# EasyEDA Pro project MiniPID_Manual.epro, schematic Schematic1
Board Name: Board1; Create Date: 2026-11-03; Page Name: P1; Project Name: MiniPID; Schematic Name: Schematic1; Update Date: 2026-11-03; Company: EasyEDA.com; Page Size: A4; Version: V1.0
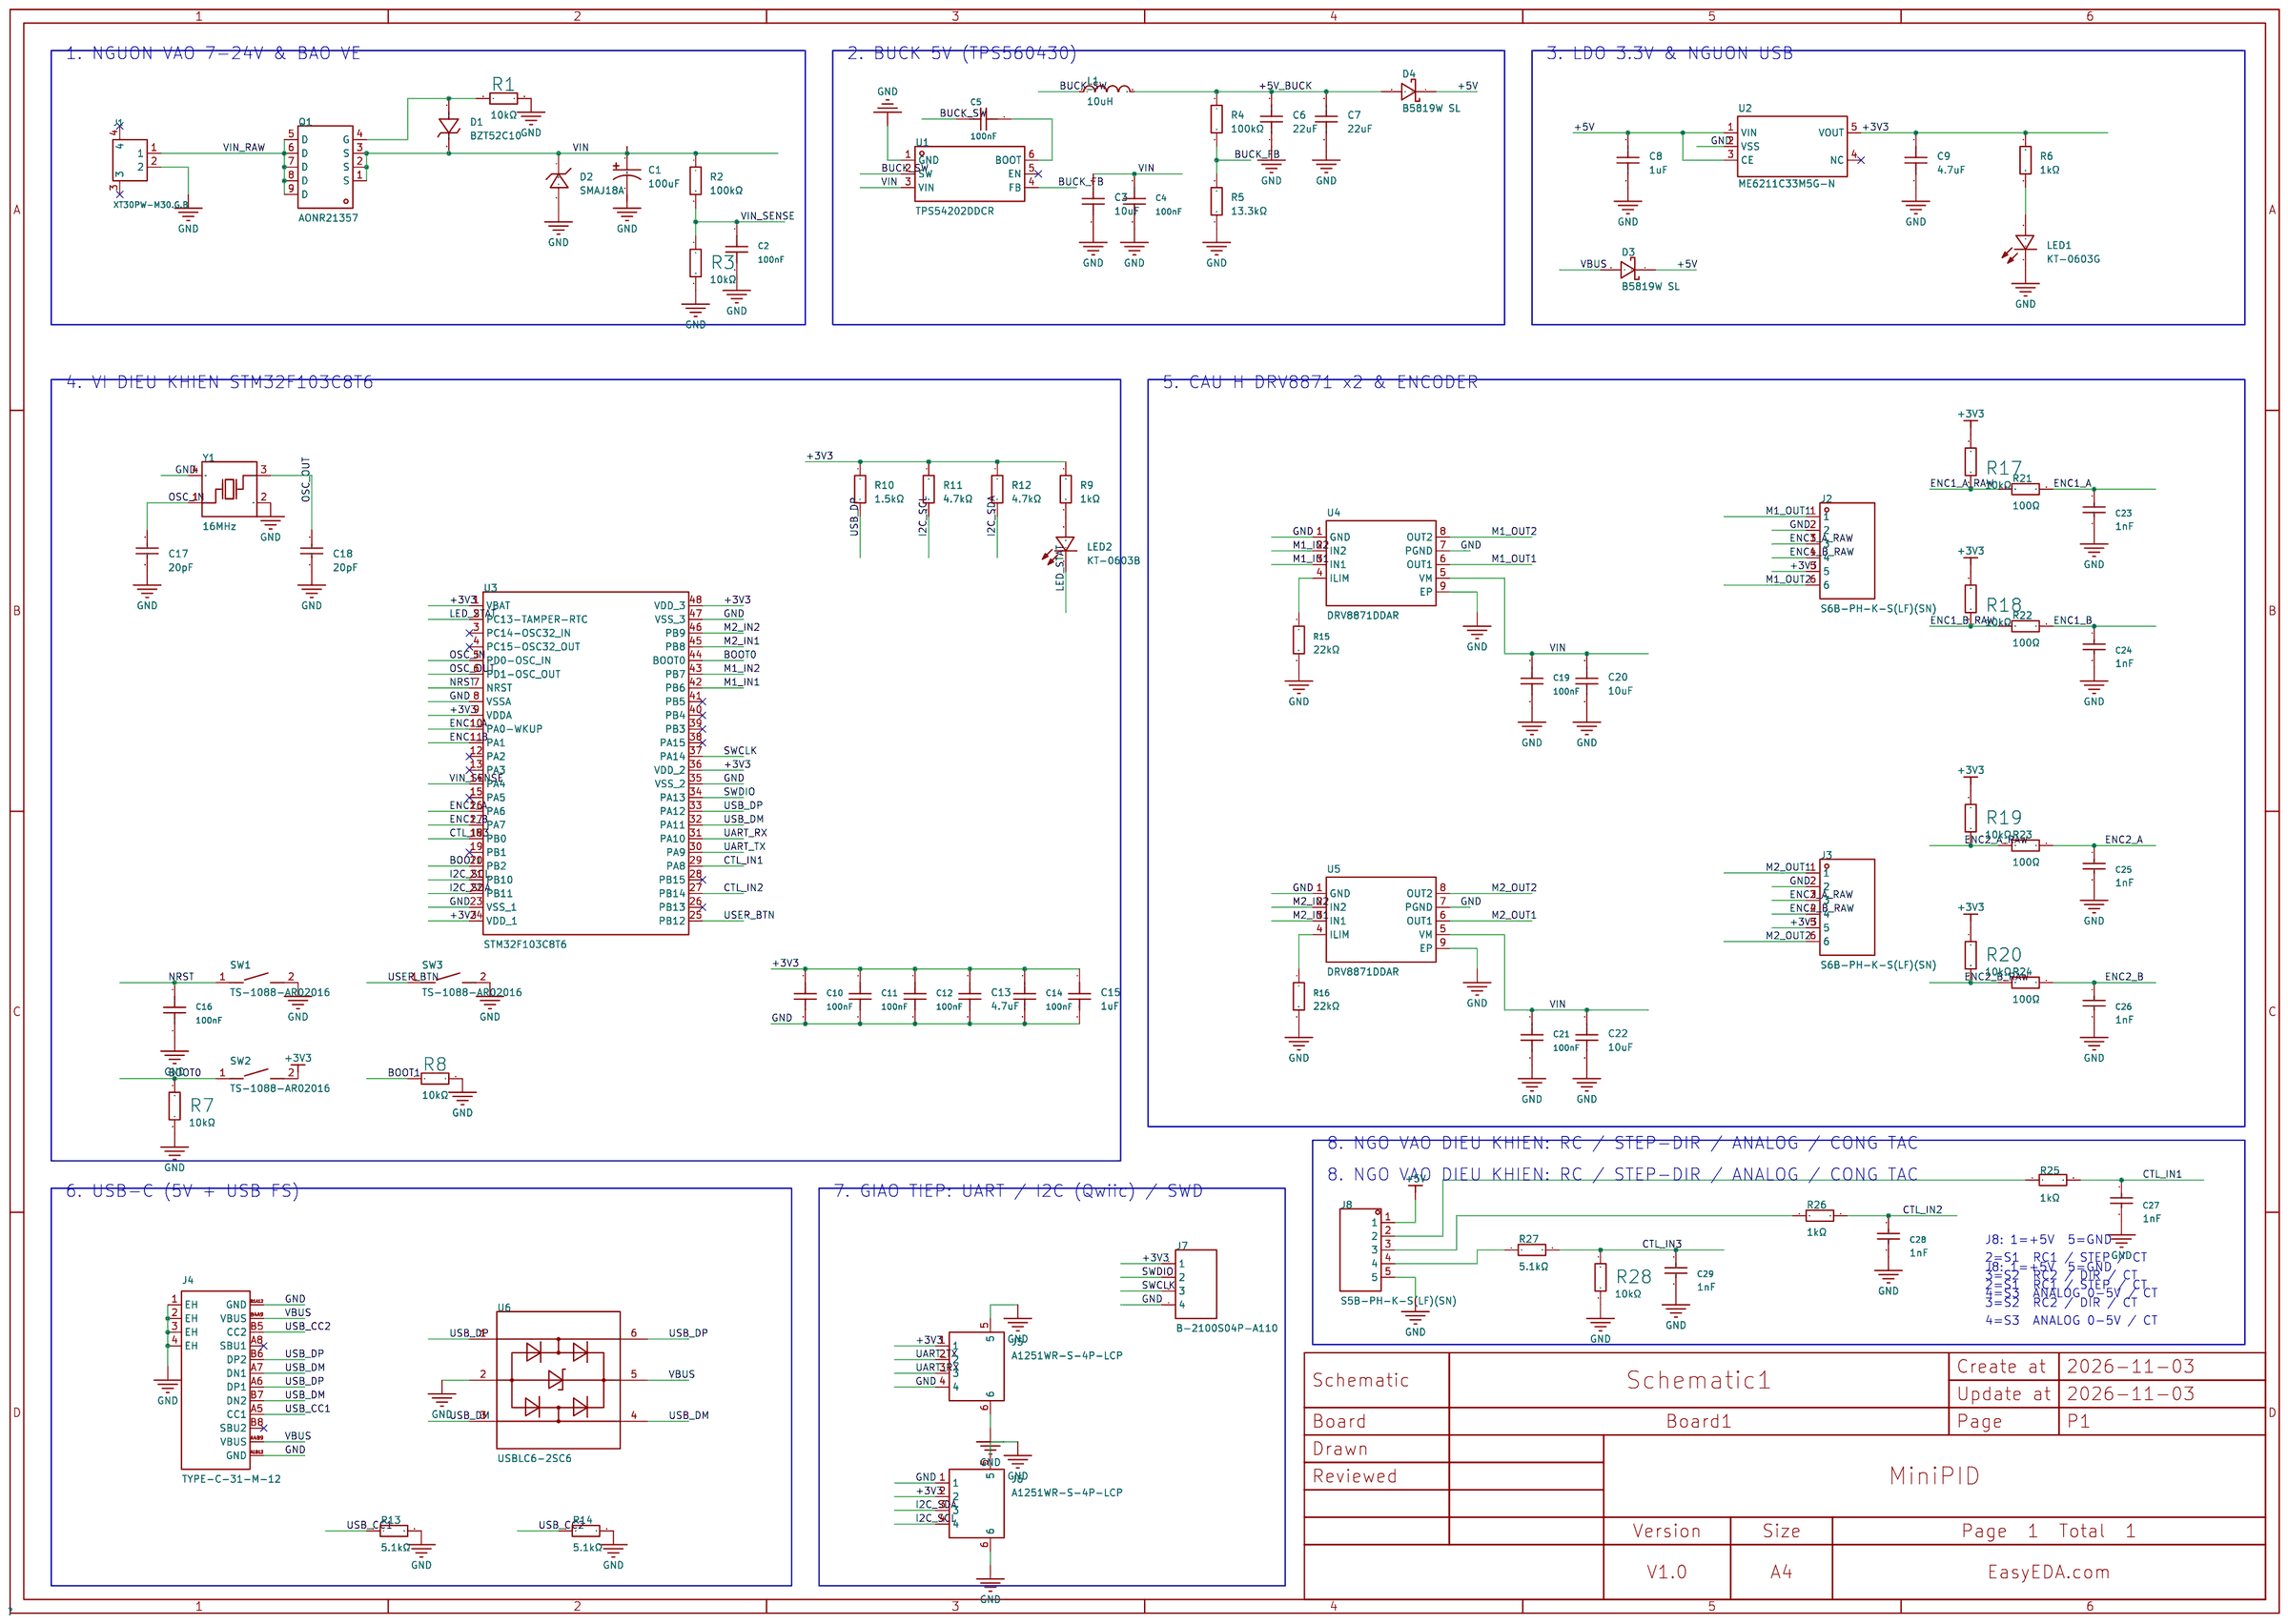
[diagram p0: schematic sheet]

## Parts
C1  100uF  [CAP-TH_BD6.3-P2.50-D1.0-FD]
C2  100nF  [C0603]
C3  10uF  [C0805]
C4  100nF  [C0603]
C5  100nF  [C0603]
C6  22uF  [C0805]
C7  22uF  [C0805]
C8  1uF  [C0603]
C9  4.7uF  [C0603]
C10  100nF  [C0603]
C11  100nF  [C0603]
C12  100nF  [C0603]
C13  4.7uF  [C0603]
C14  100nF  [C0603]
C15  1uF  [C0603]
C16  100nF  [C0603]
C17  20pF  [C0603]
C18  20pF  [C0603]
C19  100nF  [C0603]
C20  10uF  [C0805]
C21  100nF  [C0603]
C22  10uF  [C0805]
C23  1nF  [C0603]
C24  1nF  [C0603]
C25  1nF  [C0603]
C26  1nF  [C0603]
C27  1nF  [C0603]
C28  1nF  [C0603]
C29  1nF  [C0603]
D1  BZT52C10  [SOD-123_L2.7-W1.6-LS3.7-RD-1]
D2  SMAJ18A  [SMA_L4.3-W2.6-LS5.2-RD]
D3  B5819W SL  [SOD-123_L2.7-W1.6-LS3.7-RD-1]
D4  B5819W SL  [SOD-123_L2.7-W1.6-LS3.7-RD-1]
J1  XT30PW-M30.G.B  [CONN-TH_XT30PW-M]
J2  S6B-PH-K-S(LF)(SN)  [CONN-TH_6P-P2.00_S6B-PH-K-S-LF-SN]
J3  S6B-PH-K-S(LF)(SN)  [CONN-TH_6P-P2.00_S6B-PH-K-S-LF-SN]
J4  TYPE-C-31-M-12  [USB-C_SMD-TYPE-C-31-M-12_1]
J5  A1251WR-S-4P-LCP  [CONN-SMD_A1251WR-S-4P]
J6  A1251WR-S-4P-LCP  [CONN-SMD_A1251WR-S-4P]
J7  B-2100S04P-A110  [HDR-TH_4P-P2.54-V-M]
J8  S5B-PH-K-S(LF)(SN)  [CONN-TH_S5B-PH-K-S-LF-SN]
L1  10uH  [IND-SMD_L6.0-W6.0_SWPA6045S]
LED1  KT-0603G  [LED0603-RD]
LED2  KT-0603B  [LED0603-RD]
Q1  AONR21357  [DFN-8_L3.0-W3.0-P0.65-BL]
R1  10kΩ  [R0603]
R2  100kΩ  [R0603]
R3  10kΩ  [R0603]
R4  100kΩ  [R0603]
R5  13.3kΩ  [R0603]
R6  1kΩ  [R0603]
R7  10kΩ  [R0603]
R8  10kΩ  [R0603]
R9  1kΩ  [R0603]
R10  1.5kΩ  [R0603]
R11  4.7kΩ  [R0603]
R12  4.7kΩ  [R0603]
R13  5.1kΩ  [R0603]
R14  5.1kΩ  [R0603]
R15  22kΩ  [R0603]
R16  22kΩ  [R0603]
R17  10kΩ  [R0603]
R18  10kΩ  [R0603]
R19  10kΩ  [R0603]
R20  10kΩ  [R0603]
R21  100Ω  [R0603]
R22  100Ω  [R0603]
R23  100Ω  [R0603]
R24  100Ω  [R0603]
R25  1kΩ  [R0603]
R26  1kΩ  [R0603]
R27  5.1kΩ  [R0603]
R28  10kΩ  [R0603]
SW1  TS-1088-AR02016  [SW-SMD_L3.9-W3.0-P4.45]
SW2  TS-1088-AR02016  [SW-SMD_L3.9-W3.0-P4.45]
SW3  TS-1088-AR02016  [SW-SMD_L3.9-W3.0-P4.45]
U1  TPS54202DDCR  [SOT-23-6_L2.9-W1.6-P0.95-LS2.8-BL]
U2  ME6211C33M5G-N  [SOT-23-5_L3.0-W1.7-P0.95-LS2.8-BL]
U3  STM32F103C8T6  [LQFP-48_L7.0-W7.0-P0.50-LS9.0-BL]
U4  DRV8871DDAR  [SO-8_L4.9-W3.9-P1.27-LS6.0-BL-EP]
U5  DRV8871DDAR  [SO-8_L4.9-W3.9-P1.27-LS6.0-BL-EP]
U6  USBLC6-2SC6  [SOT-23-6_L2.9-W1.6-P0.95-LS2.8-BL]
Y1  16MHz  [CRYSTAL-SMD_4P-L3.2-W2.5-BL]

## Library data of the parts
C1 = NXA35VB100M6.3*11_LO: Capacitance: Rated Voltage: Lead Spacing: φD: L: Lifetime @ Temp:; LCSC Part Name: 100uF 35V; Supplier Part: C346956; Supplier Footprint: 插件,6.3x11mm; JLCPCB Part Class: Extended Part; Supplier: LCSC
C2 C4 C5 C10-C12 C14 C16 C19 C21 = CC0603KRX7R9BB104: Capacitance:100nF Tolerance:±10% Tolerance:±10% Voltage Rating:50V Temperature Coefficient:X7R; LCSC Part Name: 100nF ±10% 50V; Supplier Part: C14663; Manufacturer: YAGEO(国巨); Supplier Footprint: 0603; JLCPCB Part Class: Basic Part; Datasheet: https://item.szlcsc.com/datasheet/CC0603KRX7R9BB104/15331.html; Supplier: LCSC; Tolerance: ±10%; Voltage Rating: 50V; Temperature Coefficient: X7R
C3 C20 C22 = GRM21BR61H106KE43L: Capacitance:10uF Tolerance:±10% Tolerance:±10% Voltage Rating:50V Temperature Coefficient:X5R; LCSC Part Name: 10uF ±10% 50V; Supplier Part: C440198; Manufacturer: muRata(村田); Supplier Footprint: 0805; JLCPCB Part Class: Basic Part; Datasheet: https://item.szlcsc.com/datasheet/GRM21BR61H106KE43L/439567.html; Supplier: LCSC; Tolerance: ±10%; Voltage Rating: 50V; Temperature Coefficient: X5R
C6 C7 = CL21A226MAQNNNE: Capacitance:22uF Tolerance:±20% Tolerance:±20% Voltage Rating:25V Temperature Coefficient:X5R; LCSC Part Name: 22uF ±20% 25V; Supplier Part: C45783; Manufacturer: SAMSUNG(三星); Supplier Footprint: 0805; JLCPCB Part Class: Basic Part; Datasheet: https://item.szlcsc.com/datasheet/CL21A226MAQNNNE/46786.html; Supplier: LCSC; Tolerance: ±20%; Voltage Rating: 25V; Temperature Coefficient: X5R
C8 C15 = CL10A105KB8NNNC: Capacitance:1uF Tolerance:±10% Tolerance:±10% Voltage Rating:50V Temperature Coefficient:X5R; LCSC Part Name: 1uF ±10% 50V; Supplier Part: C15849; Manufacturer: SAMSUNG(三星); Supplier Footprint: 0603; JLCPCB Part Class: Basic Part; Datasheet: https://item.szlcsc.com/datasheet/CL10A105KB8NNNC/16531.html; Supplier: LCSC; Tolerance: ±10%; Voltage Rating: 50V; Temperature Coefficient: X5R
C9 C13 = CL10A475KO8NNNC: Capacitance:4.7uF Tolerance:±10% Tolerance:±10% Voltage Rating:16V Temperature Coefficient:X5R; LCSC Part Name: 4.7uF ±10% 16V; Supplier Part: C19666; Manufacturer: SAMSUNG(三星); Supplier Footprint: 0603; JLCPCB Part Class: Basic Part; Datasheet: https://item.szlcsc.com/datasheet/CL10A475KO8NNNC/20375.html; Supplier: LCSC; Tolerance: ±10%; Voltage Rating: 16V; Temperature Coefficient: X5R
C17 C18 = CL10C200JB8NNNC: Capacitance:20pF Tolerance:±5% Tolerance:±5% Voltage Rating:50V Temperature Coefficient:C0G; LCSC Part Name: 20pF ±5% 50V; Supplier Part: C1648; Manufacturer: SAMSUNG(三星); Supplier Footprint: 0603; JLCPCB Part Class: Basic Part; Datasheet: https://item.szlcsc.com/datasheet/CL10C200JB8NNNC/2000.html; Supplier: LCSC; Tolerance: ±5%; Voltage Rating: 50V; Temperature Coefficient: C0G
C23-C29 = CL10B102KB8NNNC: Capacitance:1nF Tolerance:±10% Tolerance:±10% Voltage Rating:50V Temperature Coefficient:X7R Operating Temperature:-55℃~+125℃ Operating Temperature:-55℃~+125℃; LCSC Part Name: 1nF ±10% 50V; Supplier Part: C1588; Manufacturer: SAMSUNG(三星); Supplier Footprint: 0603; JLCPCB Part Class: Basic Part; Datasheet: https://item.szlcsc.com/datasheet/CL10B102KB8NNNC/1940.html; Supplier: LCSC; Tolerance: ±10%; Voltage Rating: 50V; Temperature Coefficient: X7R; Operating Temperature: -55℃~+125℃
D1 = BZT52C10: Diode Configuration:1 Independent Zener Voltage(Nom):10V Reverse Leakage Current (Ir):200nA@7V Zener Voltage(Range):9.4V~10.6V Zener Voltage(Range):9.4V~10.6V Pd - Power Dissipation:500mW Impedance(Zzt):20Ω Impedance(Zzk):150Ω Operating Junction Temperatu; LCSC Part Name: 独立式 耐压:10V 电流:0.2uA@7.0V; Supplier Part: C707140; Manufacturer: Slkor(萨科微); Supplier Footprint: SOD-123; JLCPCB Part Class: Extended Part; Datasheet: https://item.szlcsc.com/datasheet/BZT52C10/744262.html; Supplier: LCSC; Diode Configuration: 1 Independent; Zener Voltage(Nom): 10V; Reverse Leakage Current (Ir): 200nA@7V; Zener Voltage(Range): 9.4V~10.6V; Pd - Power Dissipation: 500mW; Impedance(Zzt): 20Ω; Impedance(Zzk): 150Ω; Operating Junction Temperature Range: -65℃~+150℃
D2 = SMAJ18A: Reverse Stand-Off Voltage (Vrwm):18V Maximum Clamping Voltage:29.2V Peak Pulse Current (Ipp)@10/1000us:13.7A Breakdown Voltage:20V Type:TVS; LCSC Part Name: 单向TVS 18V截止 13.7A峰值脉冲; Supplier Part: C400806; Supplier Footprint: SMA; JLCPCB Part Class: Extended Part; Datasheet: https://atta.szlcsc.com/upload/public/pdf/source/20190627/C400806_7E410893A8120FEC104604328EAF2CE5.pdf; Supplier: LCSC; Reverse Stand-Off Voltage (Vrwm): 18V; Maximum Clamping Voltage: 29.2V; Peak Pulse Current (Ipp)@10/1000us: 13.7A; Breakdown Voltage: 20V; Type: TVS
D3 D4 = B5819W SL: Voltage - Forward(Vf@If):600mV@1A Voltage - DC Reverse(Vr):40V Current - Rectified:1A Non-Repetitive Peak Forward Surge Current:9A; LCSC Part Name: 电压:40V 电流:1A; Supplier Part: C8598; Manufacturer: CJ(江苏长电/长晶); Supplier Footprint: SOD-123; JLCPCB Part Class: Basic Part; Datasheet: https://item.szlcsc.com/datasheet/B5819W%2520SL/9093.html; Supplier: LCSC; Voltage - Forward(Vf@If): 600mV@1A; Voltage - DC Reverse(Vr): 40V; Current - Rectified: 1A; Non-Repetitive Peak Forward Surge Current: 9A
J1 = XT30PW-M30.G.B: LCSC Part Name: AMASS(艾迈斯)航模插头电调机插座锂电池连接器 PCB板卧式 金 黑XT30PW-M30.G.B; Supplier Part: C30170177; Manufacturer: null; JLCPCB Part Class: Extended Part; Datasheet: https://item.szlcsc.com/datasheet/XT30PW-M30.G.B/31902144.html; Supplier: LCSC
J2 J3 = S6B-PH-K-S(LF)(SN): Pins Structure:1x6P Pitch:2mm Mounting Type:Right Angle Reference Series:PH Number of Pins:6P Number of Rows:1 Number of PINs Per Row:6 Row Spacing:- Current Rating:2A Contact Material:Brass Contact Plating:Tin Operating Temperature:-25℃~+85℃ Operating Te; LCSC Part Name: 1x6P 间距:2mm 弯插 系列:PH; Supplier Part: C157920; Manufacturer: JST; Supplier Footprint: 弯插,P=2mm; JLCPCB Part Class: Extended Part; Datasheet: https://item.szlcsc.com/datasheet/S6B-PH-K-S(LF)(SN)/169268.html; Supplier: LCSC; Pins Structure: 1x6P; Pitch: 2mm; Mounting Type: Right Angle; Reference Series: PH; Number of Pins: 6P; Number of Rows: 1; Number of PINs Per Row: 6; Current Rating: 2A; Contact Material: Brass; Contact Plating: Tin; Operating Temperature: -25℃~+85℃; Voltage Rating: 100V; Plastic Material: PA66; Flame Retardant Rating: UL94V-0; Supplementary Features: K Pin; Color: White; Z-Height of the Board: 4.8mm; X-Length of Bottom Edge on Board (Spacing Line): 13.9mm; Y-Width of Bottom Edge on Board: 7.6mm
J4 = TYPE-C-31-M-12: Connector Type:Type-C Protocol Standard:- Gender:Female Mounting Type:Surface Mount, Right Angle Number of Contacts:16P Number of Ports:1 Current Rating-Power:5A Voltage Rating:20V Connect-Disconnect Life:10,000 cycles Length:7.35mm Operating Temperature:; LCSC Part Name: Type-C 母 卧贴; Supplier Part: C165948; Manufacturer: 韩国韩荣; Supplier Footprint: SMD; JLCPCB Part Class: Extended Part; Datasheet: https://item.szlcsc.com/datasheet/TYPE-C-31-M-12/177331.html; Supplier: LCSC; Connector Type: Type-C; Gender: Female; Mounting Type: Surface Mount, Right Angle; Number of Contacts: 16P; Number of Ports: 1; Current Rating-Power: 5A; Voltage Rating: 20V; Connect-Disconnect Life: 10,000 cycles; Length: 7.35mm; Operating Temperature: -30℃~+80℃
J5 J6 = A1251WR-S-4P-LCP: Pins Structure:1x4P Pitch:1.25mm Mounting Type:Surface Mount, Right Angle Reference Series:- Number of Pins:4P Number of Rows:1 Number of PINs Per Row:4 Row Spacing:- Current Rating:1A Contact Material:Phosphor Bronze Contact Plating:Tin Operating Tempera; LCSC Part Name: 1x4P 间距:1.25mm 卧贴; Supplier Part: C225113; Manufacturer: CJT(长江连接器); Supplier Footprint: SMD,P=1.25mm,卧贴; JLCPCB Part Class: Extended Part; Datasheet: https://item.szlcsc.com/datasheet/A1251WR-S-4P-LCP/225396.html; Supplier: LCSC; Pins Structure: 1x4P; Pitch: 1.25mm; Mounting Type: Surface Mount, Right Angle; Number of Pins: 4P; Number of Rows: 1; Number of PINs Per Row: 4; Current Rating: 1A; Contact Material: Phosphor Bronze; Contact Plating: Tin; Operating Temperature: -40℃~+105℃; Voltage Rating: 125V; Plastic Material: LCP; Flame Retardant Rating: UL94V-0; Color: Beige; Z-Height of the Board: 3.6mm; X-Length of Bottom Edge on Board (Spacing Line): 10.25mm; Y-Width of Bottom Edge on Board: 5.5mm
J7 = B-2100S04P-A110: Pin Structure:1x4P Pitch:2.54mm Row Spacing:- Circluar Pins/Square Pins:Pin Header Mounting Type:Through Hole Number of Rows:1 Number of Pins:4P Current Rating:3A Voltage Rating (Max):- Length of Mating Pin:6mm Insulation Height:2.54mm Length of End Conne; LCSC Part Name: 1x4P 间距:2.54mm 方针 直插; Supplier Part: C124378; Manufacturer: Ckmtw(灿科盟); Supplier Footprint: 插件,P=2.54mm; JLCPCB Part Class: Extended Part; Datasheet: https://item.szlcsc.com/datasheet/B-2100S04P-A110/125653.html; Supplier: LCSC; Pin Structure: 1x4P; Pitch: 2.54mm; Circluar Pins/Square Pins: Pin Header; Mounting Type: Through Hole; Number of Rows: 1; Number of Pins: 4P; Current Rating: 3A; Length of Mating Pin: 6mm; Insulation Height: 2.54mm; Length of End Connection Pin: 3mm; Contact Material: Brass; Operating Temperature: -40℃~+105℃; Color: Black
J8 = S5B-PH-K-S(LF)(SN): Pins Structure:1x5P Pitch:2mm Mounting Type:Right Angle Reference Series:PH Number of Pins:5P Number of Rows:1 Number of PINs Per Row:5 Row Spacing:- Current Rating:2A Contact Material:Brass Contact Plating:Tin Operating Temperature:-25℃~+85℃ Operating Te; LCSC Part Name: 1x5P 间距:2mm 弯插 系列:PH; Supplier Part: C157923; Manufacturer: JST; Supplier Footprint: 弯插,P=2mm; JLCPCB Part Class: Extended Part; Datasheet: https://item.szlcsc.com/datasheet/S5B-PH-K-S(LF)(SN)/169271.html; Supplier: LCSC; Pins Structure: 1x5P; Pitch: 2mm; Mounting Type: Right Angle; Reference Series: PH; Number of Pins: 5P; Number of Rows: 1; Number of PINs Per Row: 5; Current Rating: 2A; Contact Material: Brass; Contact Plating: Tin; Operating Temperature: -25℃~+85℃; Voltage Rating: 100V; Plastic Material: PA66; Flame Retardant Rating: UL94V-0; Supplementary Features: K Pin; Color: White; Z-Height of the Board: 4.8mm; X-Length of Bottom Edge on Board (Spacing Line): 11.9mm; Y-Width of Bottom Edge on Board: 7.6mm
L1 = SWPA6045S100MT: Inductance: Tolerance:±20% Tolerance:±20% Rated Current: Current - Saturation(Isat):3.5A DC Resistance(DCR): Type:- Ratings:-; LCSC Part Name: 10uH ±20% 3.5A; Supplier Part: C79272; Manufacturer: Sunlord(顺络); Supplier Footprint: SMD,6x6mm; JLCPCB Part Class: Extended Part; Datasheet: https://atta.szlcsc.com/upload/public/pdf/source/20231024/317626D2AA2F8AB4113C1875E432E6E1.pdf; Supplier: LCSC; Tolerance: ±20%; Current - Saturation(Isat): 3.5A
LED1 = KT-0603G: Lamp Holder Type:1.6mm x 0.8mm square LED Illumination Color:Emerald Green Voltage - Forward(Vf):3.1V Voltage - Forward(Vf):3.1V Power(Watts):100mW Forward Current:5mA Wavelength - Dominant:513nm~528nm Wavelength - Dominant:513nm~528nm Peak Wavelength:525; LCSC Part Name: 0603 翠绿 高亮; Supplier Part: C12624; Manufacturer: KENTO; Supplier Footprint: 0603; JLCPCB Part Class: Extended Part; Datasheet: https://item.szlcsc.com/datasheet/KT-0603G/13258.html; Supplier: LCSC; Lamp Holder Type: 1.6mm x 0.8mm square LED; Illumination Color: Emerald Green; Voltage - Forward(Vf): 3.1V; Power(Watts): 100mW; Forward Current: 5mA; Wavelength - Dominant: 513nm~528nm; Peak Wavelength: 525nm; Diode Configuration: Discrete Diode; Lens Color: Water Clear; Luminous Intensity: 430mcd; Viewing Angle: 120°; Operating Temperature: -40℃~+85℃
LED2 = KT-0603B: Lamp Holder Type:1.6mm x 0.8mm square LED Illumination Color:Blue Voltage - Forward(Vf):3.1V Voltage - Forward(Vf):3.1V Power(Watts):100mW Forward Current:5mA Wavelength - Dominant:460nm~475nm Wavelength - Dominant:460nm~475nm Peak Wavelength:469nm Peak W; LCSC Part Name: 0603 蓝灯 高亮; Supplier Part: C2288; Manufacturer: KENTO; Supplier Footprint: 0603; JLCPCB Part Class: Extended Part; Datasheet: https://item.szlcsc.com/datasheet/KT-0603B/2661.html; Supplier: LCSC; Lamp Holder Type: 1.6mm x 0.8mm square LED; Illumination Color: Blue; Voltage - Forward(Vf): 3.1V; Power(Watts): 100mW; Forward Current: 5mA; Wavelength - Dominant: 460nm~475nm; Peak Wavelength: 469nm; Diode Configuration: Discrete Diode; Lens Color: Water Clear; Luminous Intensity: 175mcd; Viewing Angle: 120°; Operating Temperature: -40℃~+85℃
Q1 = AONR21357: Number:1 P-Channel Drain to Source Voltage:30V Current - Continuous Drain(Id):34A RDS(on):12.3mΩ@4.5V Pd - Power Dissipation:30W Gate Threshold Voltage (Vgs(th)):1.7V Gate Charge(Qg):25nC@4.5V Input Capacitance(Ciss):2.83nF Reverse Transfer Capacitance (C; LCSC Part Name: 1个P沟道 耐压:30V 电流:34A; Supplier Part: C431196; Manufacturer: AOS; Supplier Footprint: DFN-8(3x3); JLCPCB Part Class: Extended Part; Datasheet: https://item.szlcsc.com/datasheet/AONR21357/427208.html; Supplier: LCSC; Number: 1 P-Channel; Drain to Source Voltage: 30V; Current - Continuous Drain(Id): 34A; RDS(on): 12.3mΩ@4.5V; Pd - Power Dissipation: 30W; Gate Threshold Voltage (Vgs(th)): 1.7V; Gate Charge(Qg): 25nC@4.5V; Input Capacitance(Ciss): 2.83nF; Reverse Transfer Capacitance (Crss@Vds): 365pF; Operating Temperature: -55℃~+150℃; Type: P-Channel; Output Capacitance(Coss): 430pF; Vgs: ±25V
R1 R3 R7 R8 R17-R20 R28 = 0603WAF1002T5E: Type:Thick Film Resistor Resistance:10kΩ Tolerance:±1% Tolerance:±1% Power(Watts):100mW Voltage-Supply(Max):75V Temperature Coefficient:±100ppm/℃ Temperature Coefficient:±100ppm/℃ Operating Temperature:-55℃~+155℃ Operating Temperature:-55℃~+155℃; LCSC Part Name: 厚膜电阻 10kΩ ±1% 100mW; Supplier Part: C25804; Manufacturer: UNI-ROYAL(厚声); Supplier Footprint: 0603; JLCPCB Part Class: Basic Part; Datasheet: https://item.szlcsc.com/datasheet/0603WAF1002T5E/26547.html; Supplier: LCSC; Type: Thick Film Resistor; Tolerance: ±1%; Power(Watts): 100mW; Voltage-Supply(Max): 75V; Temperature Coefficient: ±100ppm/℃; Operating Temperature: -55℃~+155℃
R2 R4 = 0603WAF1003T5E: Type:Thick Film Resistor Resistance:100kΩ Tolerance:±1% Tolerance:±1% Power(Watts):100mW Voltage-Supply(Max):75V Temperature Coefficient:±100ppm/℃ Temperature Coefficient:±100ppm/℃ Operating Temperature:-55℃~+155℃ Operating Temperature:-55℃~+155℃; LCSC Part Name: 厚膜电阻 100kΩ ±1%; Supplier Part: C25803; Manufacturer: UNI-ROYAL(厚声); Supplier Footprint: 0603; JLCPCB Part Class: Basic Part; Datasheet: https://item.szlcsc.com/datasheet/0603WAF1003T5E/26546.html; Supplier: LCSC; Type: Thick Film Resistor; Tolerance: ±1%; Power(Watts): 100mW; Voltage-Supply(Max): 75V; Temperature Coefficient: ±100ppm/℃; Operating Temperature: -55℃~+155℃
R5 = 0603WAF1332T5E: Type:Thick Film Resistor Resistance:13.3kΩ Tolerance:±1% Tolerance:±1% Power(Watts):100mW Voltage-Supply(Max):75V Temperature Coefficient:±100ppm/℃ Temperature Coefficient:±100ppm/℃ Operating Temperature:-55℃~+155℃ Operating Temperature:-55℃~+155℃; LCSC Part Name: 13.3kΩ ±1% 100mW 厚膜电阻; Supplier Part: C25952; Manufacturer: UNI-ROYAL(厚声); Supplier Footprint: 0603; JLCPCB Part Class: Extended Part; Datasheet: https://item.szlcsc.com/datasheet/0603WAF1332T5E/26695.html; Supplier: LCSC; Type: Thick Film Resistor; Tolerance: ±1%; Power(Watts): 100mW; Voltage-Supply(Max): 75V; Temperature Coefficient: ±100ppm/℃; Operating Temperature: -55℃~+155℃
R6 R9 R25 R26 = 0603WAF1001T5E: Type:Thick Film Resistor Resistance:1kΩ Tolerance:±1% Tolerance:±1% Power(Watts):100mW Voltage-Supply(Max):75V Temperature Coefficient:±100ppm/℃ Temperature Coefficient:±100ppm/℃ Operating Temperature:-55℃~+155℃ Operating Temperature:-55℃~+155℃; LCSC Part Name: 1kΩ ±1% 100mW 厚膜电阻; Supplier Part: C21190; Manufacturer: UNI-ROYAL(厚声); Supplier Footprint: 0603; JLCPCB Part Class: Basic Part; Datasheet: https://item.szlcsc.com/datasheet/0603WAF1001T5E/21904.html; Supplier: LCSC; Type: Thick Film Resistor; Tolerance: ±1%; Power(Watts): 100mW; Voltage-Supply(Max): 75V; Temperature Coefficient: ±100ppm/℃; Operating Temperature: -55℃~+155℃
R10 = 0603WAF1501T5E: Type:Thick Film Resistor Resistance:1.5kΩ Tolerance:±1% Tolerance:±1% Power(Watts):100mW Voltage-Supply(Max):75V Temperature Coefficient:±100ppm/℃ Temperature Coefficient:±100ppm/℃ Operating Temperature:-55℃~+155℃ Operating Temperature:-55℃~+155℃; LCSC Part Name: 厚膜电阻 1.5kΩ ±1%; Supplier Part: C22843; Manufacturer: UNI-ROYAL(厚声); Supplier Footprint: 0603; JLCPCB Part Class: Basic Part; Datasheet: https://item.szlcsc.com/datasheet/0603WAF1501T5E/23570.html; Supplier: LCSC; Type: Thick Film Resistor; Tolerance: ±1%; Power(Watts): 100mW; Voltage-Supply(Max): 75V; Temperature Coefficient: ±100ppm/℃; Operating Temperature: -55℃~+155℃
R11 R12 = 0603WAF4701T5E: Type:Thick Film Resistor Resistance:4.7kΩ Tolerance:±1% Tolerance:±1% Power(Watts):100mW Voltage-Supply(Max):75V Temperature Coefficient:±100ppm/℃ Temperature Coefficient:±100ppm/℃ Operating Temperature:-55℃~+155℃ Operating Temperature:-55℃~+155℃; LCSC Part Name: 厚膜电阻 4.7kΩ ±1%; Supplier Part: C23162; Manufacturer: UNI-ROYAL(厚声); Supplier Footprint: 0603; JLCPCB Part Class: Basic Part; Datasheet: https://item.szlcsc.com/datasheet/0603WAF4701T5E/23889.html; Supplier: LCSC; Type: Thick Film Resistor; Tolerance: ±1%; Power(Watts): 100mW; Voltage-Supply(Max): 75V; Temperature Coefficient: ±100ppm/℃; Operating Temperature: -55℃~+155℃
R13 R14 R27 = 0603WAF5101T5E: Type:Thick Film Resistor Resistance:5.1kΩ Tolerance:±1% Tolerance:±1% Power(Watts):100mW Voltage-Supply(Max):75V Temperature Coefficient:±100ppm/℃ Temperature Coefficient:±100ppm/℃ Operating Temperature:-55℃~+155℃ Operating Temperature:-55℃~+155℃; LCSC Part Name: 厚膜电阻 5.1kΩ ±1%; Supplier Part: C23186; Manufacturer: UNI-ROYAL(厚声); Supplier Footprint: 0603; JLCPCB Part Class: Basic Part; Datasheet: https://item.szlcsc.com/datasheet/0603WAF5101T5E/23913.html; Supplier: LCSC; Type: Thick Film Resistor; Tolerance: ±1%; Power(Watts): 100mW; Voltage-Supply(Max): 75V; Temperature Coefficient: ±100ppm/℃; Operating Temperature: -55℃~+155℃
R15 R16 = 0603WAF2202T5E: Type:Thick Film Resistor Resistance:22kΩ Tolerance:±1% Tolerance:±1% Power(Watts):100mW Voltage-Supply(Max):75V Temperature Coefficient:±100ppm/℃ Temperature Coefficient:±100ppm/℃ Operating Temperature:-55℃~+155℃ Operating Temperature:-55℃~+155℃; LCSC Part Name: 22kΩ ±1% 100mW 厚膜电阻; Supplier Part: C31850; Manufacturer: UNI-ROYAL(厚声); Supplier Footprint: 0603; JLCPCB Part Class: Basic Part; Datasheet: https://item.szlcsc.com/datasheet/0603WAF2202T5E/32812.html; Supplier: LCSC; Type: Thick Film Resistor; Tolerance: ±1%; Power(Watts): 100mW; Voltage-Supply(Max): 75V; Temperature Coefficient: ±100ppm/℃; Operating Temperature: -55℃~+155℃
R21-R24 = 0603WAF1000T5E: Type:Thick Film Resistors Resistance: Tolerance:±1% Tolerance:±1% Power(Watts): Overload Voltage (Max): Temperature Coefficient:±200ppm/℃ Temperature Coefficient:±200ppm/℃ Operating Temperature Range:-55℃~+155℃ Operating Temperature Range:-55℃~+155℃; LCSC Part Name: 100Ω ±1% 100mW 厚膜电阻; Supplier Part: C22775; Manufacturer: UNI-ROYAL(厚声); Supplier Footprint: 0603; JLCPCB Part Class: Basic Part; Datasheet: https://atta.szlcsc.com/upload/public/pdf/source/20200306/C422600_1E6D84923E4A46A82E41ADD87F860B5C.pdf; Supplier: LCSC; Type: Thick Film Resistors; Tolerance: ±1%; Temperature Coefficient: ±200ppm/℃; Operating Temperature Range: -55℃~+155℃
SW1-SW3 = TS-1088-AR02016: Circuit:SPST Actuator Style:Round Button Operating Force:1.6N Mounting Type:Surface Mount,Vertical Length:3.9mm Width:3mm Switch Height:2mm with Bracket:Without Bracket Contact Current:50mA Voltage Rating:12V Actuator/Cap Color:Black With Lamp:- IP Rating; LCSC Part Name: 3.9*3*2mm 立贴 轻触开关; Supplier Part: C720477; Manufacturer: XUNPU(讯普); Supplier Footprint: SMD,4x3mm; JLCPCB Part Class: Basic Part; Datasheet: https://item.szlcsc.com/datasheet/TS-1088-AR02016/763484.html; Supplier: LCSC; Circuit: SPST; Actuator Style: Round Button; Operating Force: 1.6N; Mounting Type: Surface Mount,Vertical; Length: 3.9mm; Width: 3mm; Switch Height: 2mm; with Bracket: Without Bracket; Contact Current: 50mA; Voltage Rating: 12V; Actuator/Cap Color: Black; Termination Style: SMD(SMT) Tab; Life: 100,000 cycles; Operating Temperature: -30℃~+80℃
U1 = TPS54202DDCR: Function:Step-down type Voltage - Supply:4.5V~28V Voltage - Supply:4.5V~28V Output Voltage:- Output Voltage:- Output Current:2A Frequency - Switching:500kHz Frequency - Switching:500kHz Operating Temperature:-40℃~+125℃@(TJ) Operating Temperature:-40℃~+125; LCSC Part Name: 降压型 2A 4.5V~28V; Supplier Part: C191884; Manufacturer: TI(德州仪器); Supplier Footprint: SOT-23-6; JLCPCB Part Class: Extended Part; Datasheet: https://www.ti.com/cn/lit/ds/symlink/tps54202.pdf; Supplier: LCSC; Function: Step-down type; Voltage - Supply: 4.5V~28V; Output Current: 2A; Frequency - Switching: 500kHz; Operating Temperature: -40℃~+125℃@(TJ); Synchronous Rectifier: Yes; Number of Outputs: 1; Topology: Buck; Quiescent Current: 45uA; Switch tube (built-in/external): Built-in; Output Type: Adjustable; Features: Light load efficient mode；Cycle-by-cycle current limiting；Overcurrent Protection；EMI optimization (spread spectrum)；Hiccup current limiting
U2 = ME6211C33M5G-N: Output Configuration:Positive Voltage - Supply:6V Output Voltage:3.3V Output Voltage:3.3V Output Current:500mA Power Supply Rejection Ratio (PSRR):70dB@(1kHz) Voltage Dropout:120mV@(100mA) standby current:60uA Noise:50uVrms Features:Enable control；Short C; LCSC Part Name: 3.3V 500mA 6V; Supplier Part: C82942; Manufacturer: MICRONE(南京微盟); Supplier Footprint: SOT-23-5; JLCPCB Part Class: Extended Part; Datasheet: https://item.szlcsc.com/datasheet/ME6211C33M5G-N/84106.html; Supplier: LCSC; Output Configuration: Positive; Voltage - Supply: 6V; Output Voltage: 3.3V; Output Current: 500mA; Power Supply Rejection Ratio (PSRR): 70dB@(1kHz); Voltage Dropout: 120mV@(100mA); standby current: 60uA; Noise: 50uVrms; Features: Enable control；Short Circuit Protection；Over Current Protection; Operating Temperature: -40℃~+150℃; Output Type: Fixed; Number of Outputs: 1
U3 = STM32F103C8T6: CPU Core:ARM Cortex-M3 CPU Maximum Speed:72MHz Core Size:32 Bit Program Storage Size:64KB Program Memory Type:FLASH RAM Size:20KB EEPROM:- Number of I/O:37 ADC (Bit):12bit Oscillator Type:Built-in Voltage - Supply:2V~3.6V Voltage - Supply:2V~3.6V Operatin; LCSC Part Name: 主流增强型ARM Cortex-M3 MCU，具有64 KB Flash、72 MHz CPU、电机控制、USB和CAN; Supplier Part: C8734; Manufacturer: ST(意法半导体); Supplier Footprint: LQFP-48(7x7); JLCPCB Part Class: Extended Part; Datasheet: https://item.szlcsc.com/datasheet/STM32F103C8T6/9243.html; Supplier: LCSC; CPU Core: ARM Cortex-M3; CPU Maximum Speed: 72MHz; Core Size: 32 Bit; Program Storage Size: 64KB; Program Memory Type: FLASH; RAM Size: 20KB; Number of I/O: 37; ADC (Bit): 12bit; Oscillator Type: Built-in; Voltage - Supply: 2V~3.6V; Operating Temperature: -40℃~+85℃
U4 U5 = DRV8871DDAR: Technology:Yes Number of H-bridges:1 Output Current:- Output Current:- Peak Current:3.6A Voltage - Supply:- Voltage - Supply:- Interface:PWM RDS(on):565mΩ Quiescent Current(Iq):10uA Operating Temperature:-40℃~+125℃ Operating Temperature:-40℃~+125℃ Feature; LCSC Part Name: 3.6A 有刷直流电机驱动芯片 5.5V; Supplier Part: C75864; Manufacturer: TI(德州仪器); Supplier Footprint: SO-8-EP; JLCPCB Part Class: Extended Part; Datasheet: https://www.ti.com/cn/lit/ds/symlink/drv8871.pdf; Supplier: LCSC; Technology: Yes; Number of H-bridges: 1; Peak Current: 3.6A; Interface: PWM; RDS(on): 565mΩ; Quiescent Current(Iq): 10uA; Operating Temperature: -40℃~+125℃; Features: Active braking function；Interleaved conduction protection；Current sensing/regulation function
U6 = USBLC6-2SC6_C7519: Polarity:Unidirectional Reverse Stand-Off Voltage (Vrwm):5.25V Clamping Voltage:17V Peak Pulse Current (Ipp):5A Voltage - Breakdown:6V Reverse Leakage Current (Ir):150nA Number of Channels:2 Operating Temperature:-40℃~+125℃ Operating Temperature:-40℃~+125; LCSC Part Name: 单向ESD 5.25V截止 峰值脉冲电流：5A; Supplier Part: C7519; Manufacturer: ST(意法半导体); Supplier Footprint: SOT-23-6L; JLCPCB Part Class: Extended Part; Datasheet: https://item.szlcsc.com/datasheet/USBLC6-2SC6/7996.html; Supplier: LCSC; Polarity: Unidirectional; Reverse Stand-Off Voltage (Vrwm): 5.25V; Clamping Voltage: 17V; Peak Pulse Current (Ipp): 5A; Voltage - Breakdown: 6V; Reverse Leakage Current (Ir): 150nA; Number of Channels: 2; Operating Temperature: -40℃~+125℃; level of protection: IEC 61000-4-2; Type: ESD; Junction Capacitance: 3.5pF
Y1 = X322516MLB4SI: Type:Crystal Oscillator Frequency:16MHz Normal temperature Frequency Tolerance:±10ppm Normal temperature Frequency Tolerance:±10ppm Load Capacitance:9pF Frequency Stability:±20ppm Frequency Stability:±20ppm Equivalent Series Resistance(ESR):50Ω Operating; LCSC Part Name: YSX321SL 16MHZ 4P 3225 9PF ±10PPM -40~85℃ (±20PPM); Supplier Part: C13738; Manufacturer: YXC(扬兴晶振); Supplier Footprint: SMD3225-4P; JLCPCB Part Class: Basic Part; Datasheet: https://item.szlcsc.com/datasheet/X322516MLB4SI/14393.html; Supplier: LCSC; Type: Crystal Oscillator; Normal temperature Frequency Tolerance: ±10ppm; Load Capacitance: 9pF; Frequency Stability: ±20ppm; Equivalent Series Resistance(ESR): 50Ω; Operating Temperature: -40℃~+85℃

## Nets
+3V3: C9.1 C10.1 C11.1 C12.1 C13.1 C14.1 C15.1 J2.5 J3.5 J5.1 J6.2 J7.1 R6.1 R9.1 R10.1 R11.1 R12.1 R17.1 R18.1 R19.1 R20.1 SW2.2 U2.5(VOUT) U3.1(VBAT) U3.9(VDDA) U3.24(VDD_1) U3.36(VDD_2) U3.48(VDD_3)
+5V: C8.1 D3.1(-) D4.1(-) J8.1 U2.1(VIN) U2.3(CE)
+5V_BUCK: C6.1 C7.1 D4.2(+) L1.2 R4.1
GND: C1.2 C2.2 C3.2 C4.2 C6.2 C7.2 C8.2 C9.2 C10.2 C11.2 C12.2 C13.2 C14.2 C15.2 C16.2 C17.2 C18.2 C19.2 C20.2 C21.2 C22.2 C23.2 C24.2 C25.2 C26.2 C27.2 C28.2 C29.2 D2.2(A) J1.2 J2.2 J3.2 J4.1(EH) J4.2(EH) J4.3(EH) J4.4(EH) J4.A1B12(GND) J4.B1A12(GND) J5.4 J5.5 J5.6 J6.1 J6.5 J6.6 J7.4 J8.5 LED1.1(K) R1.2 R3.2 R5.1 R7.2 R8.2 R13.2 R14.2 R15.2 R16.2 R28.2 SW1.2 SW3.2 U1.1(GND) U2.2(VSS) U3.8(VSSA) U3.23(VSS_1) U3.35(VSS_2) U3.47(VSS_3) U4.1(GND) U4.7(PGND) U4.9(EP) U5.1(GND) U5.7(PGND) U5.9(EP) U6.2 Y1.2(GND) Y1.4(GND)
VBUS: D3.2(+) J4.A4B9(VBUS) J4.B4A9(VBUS) U6.5
VIN: C1.1 C3.1 C4.1 C19.1 C20.1 C21.1 C22.1 D1.1(C) D2.1(C) Q1.1(S) Q1.2(S) Q1.3(S) R2.1 U1.3(VIN) U4.5(VM) U5.5(VM)
VIN_RAW: J1.1 Q1.5(D) Q1.6(D) Q1.7(D) Q1.8(D) Q1.9(D)
VIN_SENSE: C2.1 R2.2 R3.1 U3.14(PA4)
BOOT0: R7.1 SW2.1 U3.44(BOOT0)
BOOT1: R8.1 U3.20(PB2)
BUCK_FB: R4.2 R5.2 U1.4(FB)
BUCK_SW: C5.1 L1.1 U1.2(SW)
CTL_IN1: C27.1 R25.2 U3.29(PA8)
CTL_IN2: C28.1 R26.2 U3.27(PB14)
CTL_IN3: C29.1 R27.2 R28.1 U3.18(PB0)
ENC1_A: C23.1 R21.2 U3.10(PA0-WKUP)
ENC1_A_RAW: J2.3 R17.2 R21.1
ENC1_B: C24.1 R22.2 U3.11(PA1)
ENC1_B_RAW: J2.4 R18.2 R22.1
ENC2_A: C25.1 R23.2 U3.16(PA6)
ENC2_A_RAW: J3.3 R19.2 R23.1
ENC2_B: C26.1 R24.2 U3.17(PA7)
ENC2_B_RAW: J3.4 R20.2 R24.1
I2C_SCL: J6.4 R11.2 U3.21(PB10)
I2C_SDA: J6.3 R12.2 U3.22(PB11)
LED_STAT: LED2.1(K) U3.2(PC13-TAMPER-RTC)
M1_IN1: U3.42(PB6) U4.3(IN1)
M1_IN2: U3.43(PB7) U4.2(IN2)
M1_OUT1: J2.1 U4.6(OUT1)
M1_OUT2: J2.6 U4.8(OUT2)
M2_IN1: U3.45(PB8) U5.3(IN1)
M2_IN2: U3.46(PB9) U5.2(IN2)
M2_OUT1: J3.1 U5.6(OUT1)
M2_OUT2: J3.6 U5.8(OUT2)
NRST: C16.1 SW1.1 U3.7(NRST)
OSC_IN: C17.1 U3.5(PD0-OSC_IN) Y1.1(OSC1)
OSC_OUT: C18.1 U3.6(PD1-OSC_OUT) Y1.3(OSC2)
SWCLK: J7.3 U3.37(PA14)
SWDIO: J7.2 U3.34(PA13)
UART_RX: J5.3 U3.31(PA10)
UART_TX: J5.2 U3.30(PA9)
USB_CC1: J4.A5(CC1) R13.1
USB_CC2: J4.B5(CC2) R14.1
USB_DM: J4.A7(DN1) J4.B7(DN2) U3.32(PA11) U6.3 U6.4
USB_DP: J4.A6(DP1) J4.B6(DP2) R10.2 U3.33(PA12) U6.1 U6.6
USER_BTN: SW3.1 U3.25(PB12)
$1N288: D1.2(A) Q1.4(G) R1.1
$1N314: LED1.2(A) R6.2
$1N369: LED2.2(A) R9.2
$1N378: R15.1 U4.4(ILIM)
$1N402: R16.1 U5.4(ILIM)
$1N482: J8.4 R27.1
$1N485: J8.3 R26.1
$1N488: J8.2 R25.1
$1N529: C5.2 U1.6(BOOT)

Not connected (* = marked no-connect by the designer): J1 3* 4*; J4 A8(SBU1)* B8(SBU2)*; U1 5(EN)*; U2 4(NC)*; U3 3(PC14-OSC32_IN)* 4(PC15-OSC32_OUT)* 12(PA2)* 13(PA3)* 15(PA5)* 19(PB1)* 26(PB13)* 28(PB15)* 38(PA15)* 39(PB3)* 40(PB4)* 41(PB5)*

## Notes on the sheet
- 1. NGUON VAO 7-24V & BAO VE
- 2. BUCK 5V (TPS560430)
- 3. LDO 3.3V & NGUON USB
- 4. VI DIEU KHIEN STM32F103C8T6
- 5. CAU H DRV8871 x2 & ENCODER
- 8. NGO VAO DIEU KHIEN: RC / STEP-DIR / ANALOG / CONG TAC
- 8. NGO VAO DIEU KHIEN: RC / STEP-DIR / ANALOG / CONG TAC
- 6. USB-C (5V + USB FS)
- 7. GIAO TIEP: UART / I2C (Qwiic) / SWD
- J8: 1=+5V  5=GND
- 2=S1  RC1 / STEP / CT
- J8: 1=+5V  5=GND
- 2=S1  RC1 / STEP / CT
- 3=S2  RC2 / DIR / CT
- 3=S2  RC2 / DIR / CT
- 4=S3  ANALOG 0-5V / CT
- 4=S3  ANALOG 0-5V / CT
